# Altium schematic sheet motor_interfaces.SchDoc
size B
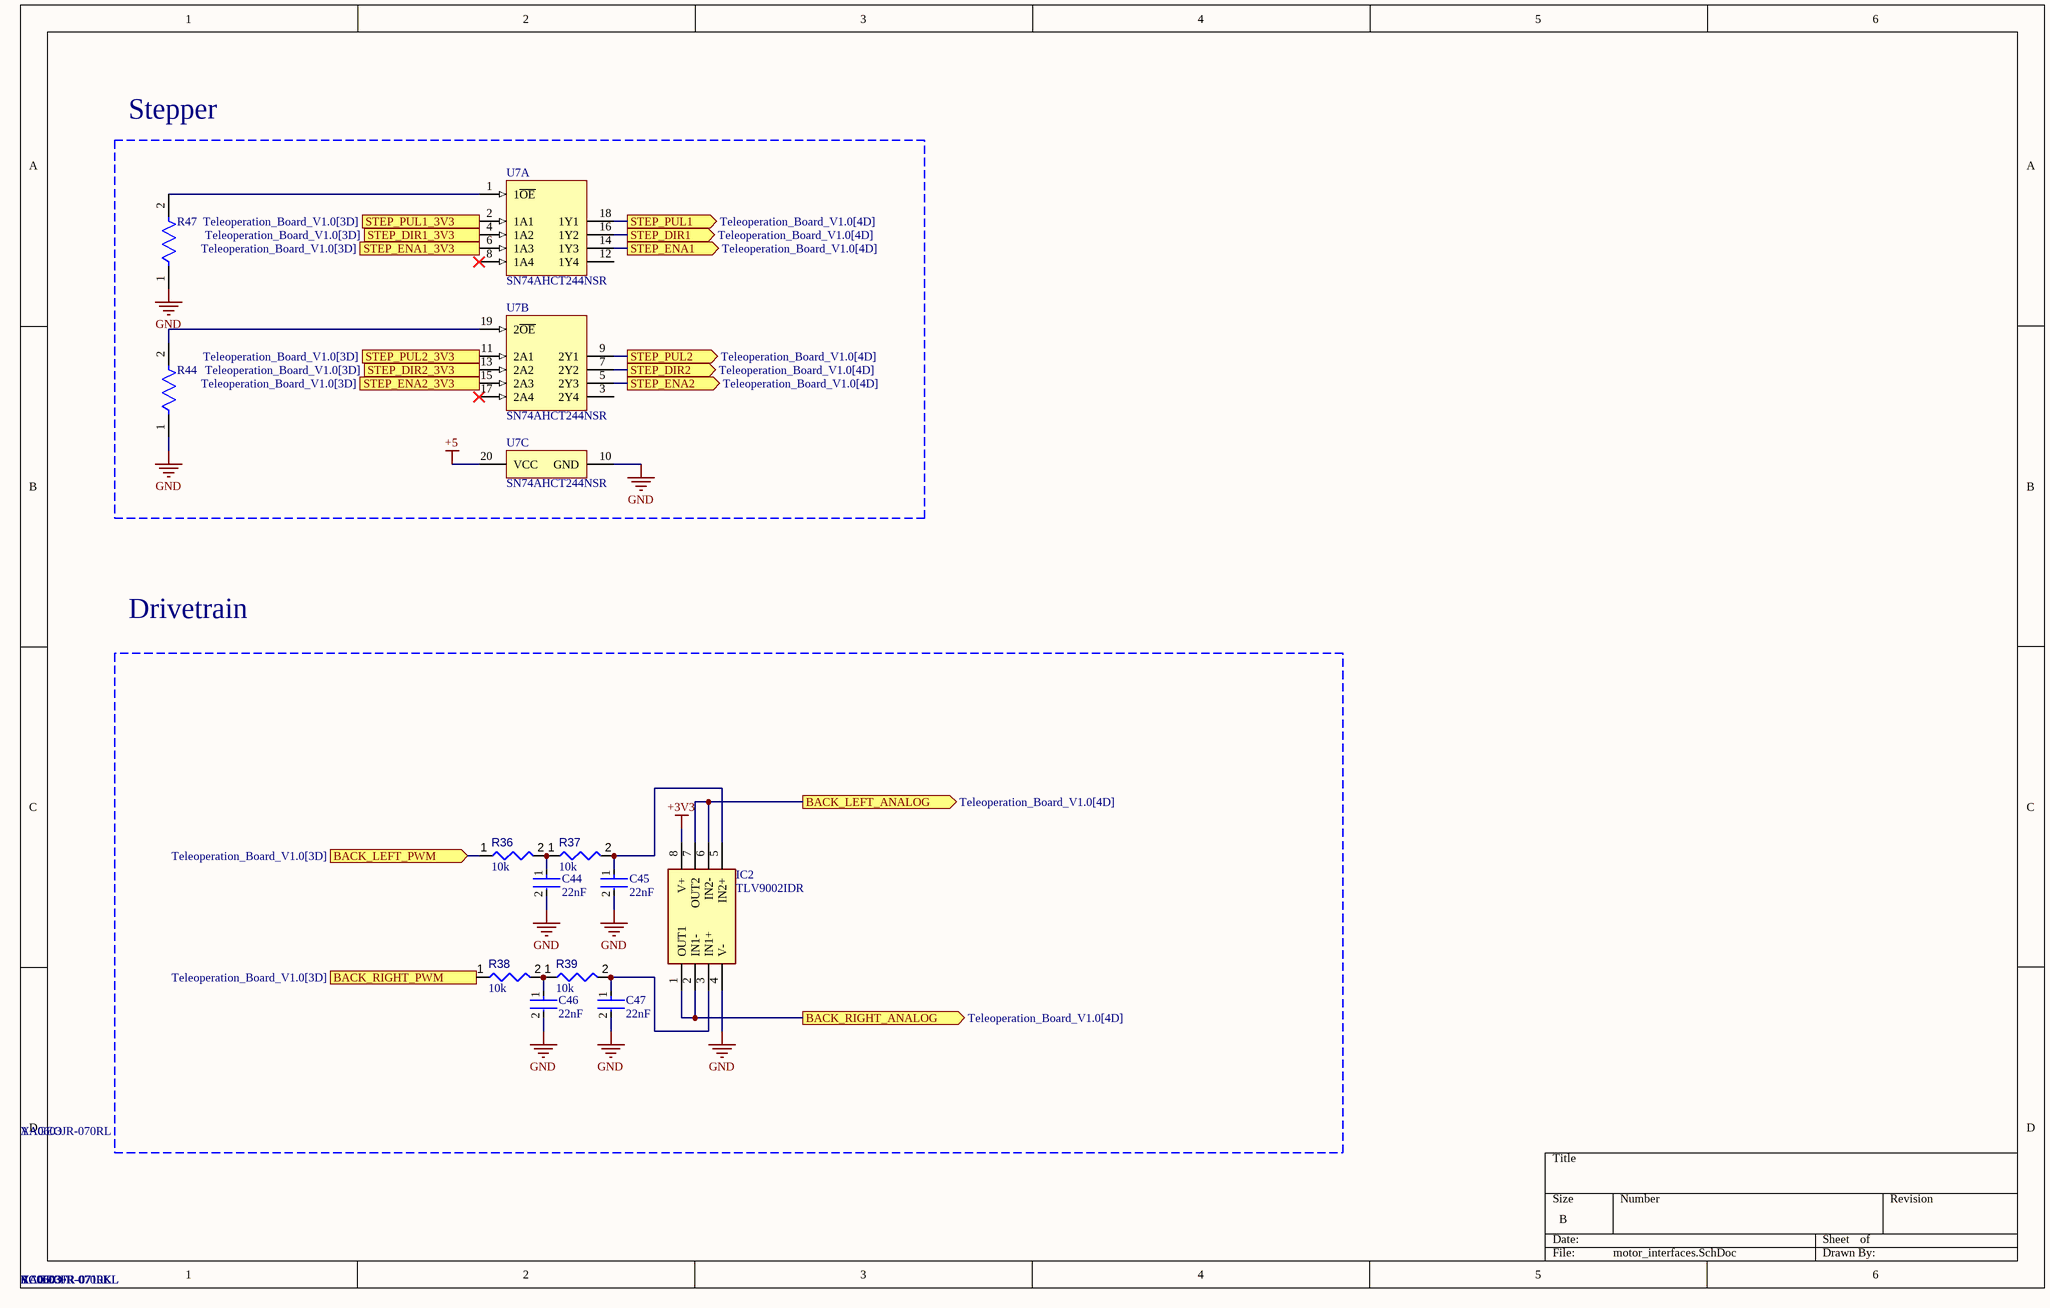
[diagram p0: motor_interfaces.SchDoc]

## Parts
C44  22nF  [FP-CC0603-DA-MFG]
C45  22nF  [FP-CC0603-DA-MFG]
C46  22nF  [FP-CC0603-DA-MFG]
C47  22nF  [FP-CC0603-DA-MFG]
IC2  TLV9002IDR  [SOIC127P600X175-8N]
R36  value 10k  Manufacturer: YAGEO  Manufacturer Part Number: RC0603FR-0710KL  [RESC1608X55X25ML10T15]  (hidden comment: Resistor 10k +/-1% 0603 100 mW)
R37  value 10k  Manufacturer: YAGEO  Manufacturer Part Number: RC0603FR-0710KL  [RESC1608X55X25ML10T15]  (hidden comment: Resistor 10k +/-1% 0603 100 mW)
R38  value 10k  Manufacturer: YAGEO  Manufacturer Part Number: RC0603FR-0710KL  [RESC1608X55X25ML10T15]  (hidden comment: Resistor 10k +/-1% 0603 100 mW)
R39  value 10k  Manufacturer: YAGEO  Manufacturer Part Number: RC0603FR-0710KL  [RESC1608X55X25ML10T15]  (hidden comment: Resistor 10k +/-1% 0603 100 mW)
R44  Manufacturer: YAGEO  [FP-AF0603-IPC_C]  (hidden comment: AA0603JR-070RL)
R47  Manufacturer: YAGEO  [FP-AF0603-IPC_C]  (hidden comment: AA0603JR-070RL)
U7  SN74AHCT244NSR  [NS0020A_L]  (parts A,B,C of 3)

## Blocks framed on the sheet
Stepper: R44 R47 U7

## Ports
BACK_LEFT_ANALOG (out, see Teleoperation_Board_V1.0[4D]), BACK_LEFT_PWM (in, see Teleoperation_Board_V1.0[3D]), BACK_RIGHT_ANALOG (out, see Teleoperation_Board_V1.0[4D]), BACK_RIGHT_PWM (in, see Teleoperation_Board_V1.0[3D]), STEP_DIR1 (out, see Teleoperation_Board_V1.0[4D]), STEP_DIR1_3V3 (in, see Teleoperation_Board_V1.0[3D]), STEP_DIR2 (out, see Teleoperation_Board_V1.0[4D]), STEP_DIR2_3V3 (in, see Teleoperation_Board_V1.0[3D]), STEP_ENA1 (out, see Teleoperation_Board_V1.0[4D]), STEP_ENA1_3V3 (in, see Teleoperation_Board_V1.0[3D]), STEP_ENA2 (out, see Teleoperation_Board_V1.0[4D]), STEP_ENA2_3V3 (in, see Teleoperation_Board_V1.0[3D]), STEP_PUL1 (out, see Teleoperation_Board_V1.0[4D]), STEP_PUL1_3V3 (in, see Teleoperation_Board_V1.0[3D]), STEP_PUL2 (out, see Teleoperation_Board_V1.0[4D]), STEP_PUL2_3V3 (in, see Teleoperation_Board_V1.0[3D])

## Nets
+3V3: IC2.8(V+)
+5: U7.20(VCC)
GND: C44.2 C45.2 C46.2 C47.2 IC2.4(V-) R44.1 R47.1 U7.10(GND)
BACK_LEFT_ANALOG: IC2.6(IN2-) IC2.7(OUT2) ; port BACK_LEFT_ANALOG
BACK_LEFT_PWM: R36.1 ; port BACK_LEFT_PWM
BACK_RIGHT_ANALOG: IC2.1(OUT1) IC2.2(IN1-) ; port BACK_RIGHT_ANALOG
BACK_RIGHT_PWM: R38.1 ; port BACK_RIGHT_PWM
STEP_DIR1: U7.16(1Y2) ; port STEP_DIR1
STEP_DIR1_3V3: U7.4(1A2) ; port STEP_DIR1_3V3
STEP_DIR2: U7.7(2Y2) ; port STEP_DIR2
STEP_DIR2_3V3: U7.13(2A2) ; port STEP_DIR2_3V3
STEP_ENA1: U7.14(1Y3) ; port STEP_ENA1
STEP_ENA1_3V3: U7.6(1A3) ; port STEP_ENA1_3V3
STEP_ENA2: U7.5(2Y3) ; port STEP_ENA2
STEP_ENA2_3V3: U7.15(2A3) ; port STEP_ENA2_3V3
STEP_PUL1: U7.18(1Y1) ; port STEP_PUL1
STEP_PUL1_3V3: U7.2(1A1) ; port STEP_PUL1_3V3
STEP_PUL2: U7.9(2Y1) ; port STEP_PUL2
STEP_PUL2_3V3: U7.11(2A1) ; port STEP_PUL2_3V3
NetC44_1: C44.1 R36.2 R37.1
NetC45_1: C45.1 IC2.5(IN2+) R37.2
NetC46_1: C46.1 R38.2 R39.1
NetC47_1: C47.1 IC2.3(IN1+) R39.2
NetR44_2: R44.2 U7.19(2~{OE})
NetR47_2: R47.2 U7.1(1~{OE})

Not connected (* = marked no-connect by the designer): U7 3(2Y4) 8(1A4)* 12(1Y4) 17(2A4)*

## Notes on the sheet
- Drivetrain

## Library data of the parts
C44-C47 = CMP-03422-000397-1: CC0603 22 nF X7R 20.00% 50 V; Manufacturer Part Number: CC0603MRX7R9BB223; Manufacturer: YAGEO; Material: Ceramic; Tolerance: 0.2; Temperature Coefficient: 15%; Voltage: 50 V; Lead Free: Yes; Height: 0.9mm; Device Class L1: Passive Components; RoHS: TRUE; Footprint Url: http://www.yageo.com/exep/pages/download/literatures/UPY-C_GEN_24.pdf; Value: 22 nF; ComponentLink2URL: http://www.yageo.com/documents/recent/UPY-GPHC_X7R_6.3V-to-50V_18.pdf; Automotive: No; Device Class L2: Capacitors; Temperature: -55°C to +125°C; Capacitance: 22 nF; Mouser Description: Surface Mount Ceramic Multilayer Capacitor 0.022uF 20% X7R 50V 0603 Paper T/R; Temperature Range High: +125°C; Temperature Range Low: -55°C; Octopart: https://octopart.com/cc0603mrx7r9bb223-yageo-88025763; Temperature Characteristic: X7R; Package: CC0603-DA; ComponentLink2Description: Datasheet; Category: Cap; Voltage Rating: 50 V; Device Class L3: Ceramic Capacitors
IC2 = TLV9002IDR: Integrated Circuit; Manufacturer_Name: Texas Instruments; Datasheet Link: http://www.ti.com/lit/gpn/tlv9002; Height: 1.75mm; Manufacturer_Part_Number: TLV9002IDR; Mouser Part Number: 595-TLV9002IDR; Mouser Price/Stock: https://www.mouser.co.uk/ProductDetail/Texas-Instruments/TLV9002IDR?qs=xhbEVWpZdWdPu%252BhBN%252BBREg%3D%3D; Arrow Part Number: TLV9002IDR; Arrow Price/Stock: https://www.arrow.com/en/products/tlv9002idr/texas-instruments?utm_currency=USD&region=europe
R36-R39 = CMP-009-00017-5: Chip Resistor, 10 KOhm, +/- 1%, 01 W, -55 to 155 degC, 0603 (1608 Metric); Voltage Rating: 50V; Power: 100mW; RoHS Compliant: True; Min Operating Temperature: -55°C; Pins: 2; Case/Package: 0603; Mounting Technology: SM; Max Operating Temperature: 155°C; Tolerance: 1%
R44 R47 = CMP-03412-040480-1: Anti-Sulfurated Chip Resistors Automotive Grade 0Ω   0603; Max Power Dissipation: 100mW; Resistance: 0R; Tolerance: 5%; RoHS Compliant: Yes; Features: Moisture Resistant; Height: 0.022inch; Length: 0.063inch; Width: 0.031inch; Min Operating Temperature: -55°C; Max Operating Temperature: 155°C; Number of Terminations: 2; Case/Package: 0603; Series: AF; Resistor Type: Thick Film; Packaging: Tape and Reel; Manufacturer Part Number: AA0603JR-070RL
U7 = CMP-0440-01048-3: Octal Buffers/Drivers With 3-State Outputs, NS0020A, LARGE T&R; Manufacturer: Texas Instruments; Bits(#): 8; ICC @ Nom Voltage(Max)(mA): 0.04; F @ Nom Voltage(Max)(Mhz): 110; VCC(Max)(V): 5.5; Input Type: TTL; Output Type: CMOS; VCC(Min)(V): 4.5; Voltage(Nom)(V): 5; Rating: Catalog; tpd @ Nom Voltage(Max)(ns): 9.5; PackageReference: NS0020A; PackageVersion: http://www.ti.com/lit/ml/msop002a/msop002a.pdf; Generic Part Number: SN74AHCT244; DatasheetVersion: SCLS228M; Operating Temperature Range(C): -40 to 85